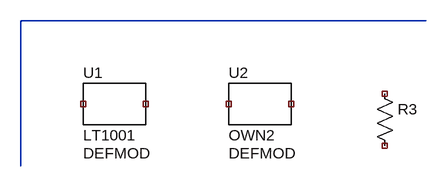
[diagram p0: schematic attribute_defaults.asc]
attribute_defaults.asc, the LTspice schematic file:
Version 4
SHEET 1 720 280
WIRE -32 -64 592 -64
WIRE -32 -64 -32 160
SYMBOL defaulted 112 64 R0
SYMATTR InstName U1
SYMBOL defaulted 336 64 R0
SYMATTR InstName U2
SYMATTR Value OWN2
SYMBOL res 512 32 R0
WINDOW 38 32 76 Left 2
WINDOW 40 32 104 Left 2
SYMATTR InstName R3
SYMATTR Value ""
SYMATTR SpiceModel ""
SYMATTR SpiceLine2 ""

The netlist it stands for:
* attribute_defaults.asc
XU1 NC_01 NC_02 DEFMOD LT1001  ; pins A B
XU2 NC_03 NC_04 DEFMOD OWN2  ; pins A B
R3 NC_05 NC_06
.backanno
.end